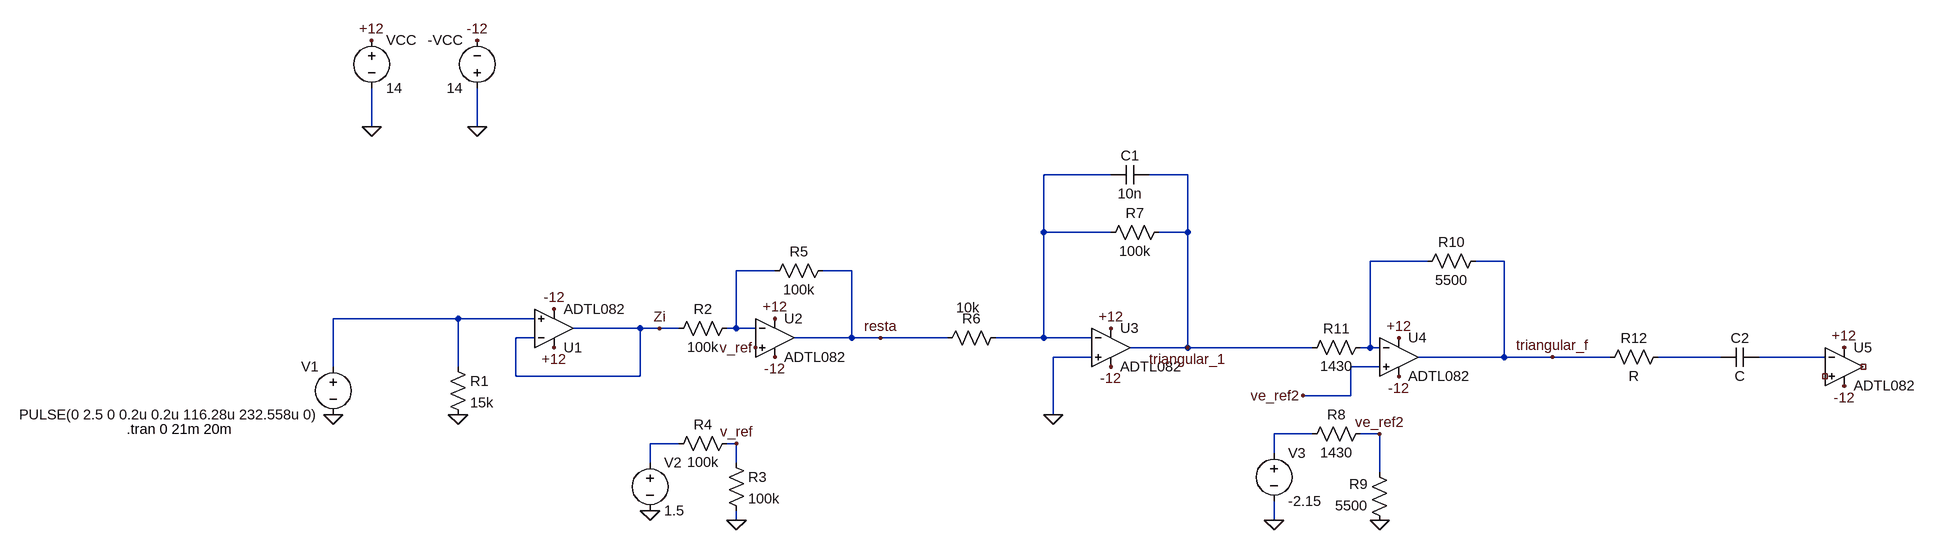
[diagram p0: schematic Draft1.asc]
Draft1.asc, the LTspice schematic file:
Version 4.1
SHEET 1 2540 680
WIRE -160 -240 -160 -304
WIRE 16 -240 16 -304
WIRE 1072 -160 960 -160
WIRE 1200 -160 1136 -160
WIRE 960 -64 960 -160
WIRE 1072 -64 960 -64
WIRE 1200 -64 1200 -160
WIRE 1200 -64 1152 -64
WIRE 1600 -16 1504 -16
WIRE 1728 -16 1680 -16
WIRE 512 0 448 0
WIRE 640 0 592 0
WIRE -16 80 -224 80
WIRE 112 80 -16 80
WIRE 288 96 176 96
WIRE 320 96 288 96
WIRE 352 96 320 96
WIRE 448 96 448 0
WIRE 448 96 432 96
WIRE 480 96 448 96
WIRE 112 112 80 112
WIRE 640 112 640 0
WIRE 640 112 544 112
WIRE 688 112 640 112
WIRE 800 112 688 112
WIRE 960 112 960 -64
WIRE 960 112 880 112
WIRE 1040 112 960 112
WIRE 1200 128 1200 -64
WIRE 1200 128 1104 128
WIRE 1408 128 1200 128
WIRE 1504 128 1504 -16
WIRE 1504 128 1488 128
WIRE 1520 128 1504 128
WIRE 1040 144 976 144
WIRE 1728 144 1728 -16
WIRE 1728 144 1584 144
WIRE 1808 144 1728 144
WIRE 1904 144 1808 144
WIRE 2160 144 1984 144
WIRE 2384 144 2224 144
WIRE -224 160 -224 80
WIRE -16 160 -16 80
WIRE 1520 160 1472 160
WIRE 80 176 80 112
WIRE 288 176 288 96
WIRE 288 176 80 176
WIRE 1472 208 1472 160
WIRE 1472 208 1392 208
WIRE 976 240 976 144
WIRE 1408 272 1344 272
WIRE 1520 272 1488 272
WIRE 352 288 304 288
WIRE 448 288 432 288
WIRE 1344 304 1344 272
WIRE 304 320 304 288
WIRE 448 320 448 288
WIRE 1520 336 1520 272
WIRE 448 416 448 400
WIRE 1344 416 1344 384
FLAG 16 -240 0
FLAG -160 -240 0
FLAG -160 -384 +12
FLAG 16 -384 -12
FLAG -16 240 0
FLAG -224 240 0
FLAG 144 128 +12
FLAG 144 64 -12
FLAG 320 96 Zi
FLAG 512 80 +12
FLAG 512 144 -12
FLAG 448 416 0
FLAG 304 400 0
FLAG 448 288 v_ref
FLAG 480 128 v_ref
FLAG 688 112 resta
FLAG 1072 96 +12
FLAG 1072 160 -12
FLAG 976 240 0
FLAG 1552 112 +12
FLAG 1552 176 -12
FLAG 1344 416 0
FLAG 1520 416 0
FLAG 1520 272 ve_ref2
FLAG 1392 208 ve_ref2
FLAG 1200 128 triangular_1
FLAG 1808 144 triangular_f
FLAG 2416 128 +12
FLAG 2416 192 -12
SYMBOL OpAmps\\ADTL082 144 160 M180
SYMATTR InstName U1
SYMBOL voltage -224 144 M0
WINDOW 123 0 0 Left 0
WINDOW 39 0 0 Left 0
SYMATTR InstName V1
SYMATTR Value PULSE(0 2.5 0 0.2u 0.2u 116.28u 232.558u 0)
SYMBOL res -32 144 R0
SYMATTR InstName R1
SYMATTR Value 15k
SYMBOL voltage -160 -400 R0
WINDOW 123 0 0 Left 0
WINDOW 39 0 0 Left 0
SYMATTR InstName VCC
SYMATTR Value 14
SYMBOL voltage 16 -288 R180
WINDOW 0 24 96 Left 2
WINDOW 3 24 16 Left 2
SYMATTR InstName -VCC
SYMATTR Value 14
SYMBOL voltage 304 304 R0
WINDOW 123 0 0 Left 0
WINDOW 39 0 0 Left 0
SYMATTR InstName V2
SYMATTR Value 1.5
SYMBOL res 448 80 R90
WINDOW 0 0 56 VBottom 2
WINDOW 3 32 56 VTop 2
SYMATTR InstName R2
SYMATTR Value 100k
SYMBOL OpAmps\\ADTL082 512 48 R0
SYMATTR InstName U2
SYMBOL res 432 304 R0
SYMATTR InstName R3
SYMATTR Value 100k
SYMBOL res 448 272 R90
WINDOW 0 0 56 VBottom 2
WINDOW 3 32 56 VTop 2
SYMATTR InstName R4
SYMATTR Value 100k
SYMBOL res 496 16 R270
WINDOW 0 32 56 VTop 2
WINDOW 3 0 56 VBottom 2
SYMATTR InstName R5
SYMATTR Value 100k
SYMBOL OpAmps\\ADTL082 1072 64 R0
SYMATTR InstName U3
SYMBOL res 896 96 R90
WINDOW 0 0 56 VBottom 2
WINDOW 3 -50 62 VTop 2
SYMATTR InstName R6
SYMATTR Value 10k
SYMBOL res 1168 -80 R90
WINDOW 0 0 56 VBottom 2
WINDOW 3 32 56 VTop 2
SYMATTR InstName R7
SYMATTR Value 100k
SYMBOL cap 1136 -176 R90
WINDOW 0 0 32 VBottom 2
WINDOW 3 32 32 VTop 2
SYMATTR InstName C1
SYMATTR Value 10n
SYMBOL OpAmps\\ADTL082 1552 80 R0
SYMATTR InstName U4
SYMBOL voltage 1344 288 R0
SYMATTR InstName V3
SYMATTR Value -2.15
SYMBOL res 1504 256 R90
WINDOW 0 0 56 VBottom 2
WINDOW 3 32 56 VTop 2
SYMATTR InstName R8
SYMATTR Value 1430
SYMBOL res 1536 432 R180
WINDOW 0 36 76 Left 2
WINDOW 3 36 40 Left 2
SYMATTR InstName R9
SYMATTR Value 5500
SYMBOL res 1584 0 R270
WINDOW 0 32 56 VTop 2
WINDOW 3 0 56 VBottom 2
SYMATTR InstName R10
SYMATTR Value 5500
SYMBOL res 1392 144 R270
WINDOW 0 32 56 VTop 2
WINDOW 3 0 56 VBottom 2
SYMATTR InstName R11
SYMATTR Value 1430
SYMBOL OpAmps\\ADTL082 2416 96 R0
SYMATTR InstName U5
SYMBOL res 2000 128 R90
WINDOW 0 0 56 VBottom 2
WINDOW 3 32 56 VTop 2
SYMATTR InstName R12
SYMBOL cap 2224 128 R90
WINDOW 0 0 32 VBottom 2
WINDOW 3 32 32 VTop 2
SYMATTR InstName C2
TEXT -568 264 Left 2 !.tran 0 21m 20m

The netlist it stands for:
* Draft1.asc
X§U1 N004 Zi +12 -12 Zi ADTL082  ; pins In+ In- V+ V- OUT
V1 N004 0 PULSE(0 2.5 0 0.2u 0.2u 116.28u 232.558u 0)
R1 N004 0 15k
VCC +12 0 14
V§-VCC 0 -12 14
V2 N008 0 1.5
R2 N003 Zi 100k
X§U2 v_ref N003 +12 -12 resta ADTL082  ; pins In+ In- V+ V- OUT
R3 v_ref 0 100k
R4 v_ref N008 100k
R5 N003 resta 100k
X§U3 0 N001 +12 -12 triangular_1 ADTL082  ; pins In+ In- V+ V- OUT
R6 N001 resta 10k
R7 triangular_1 N001 100k
C1 triangular_1 N001 10n
X§U4 ve_ref2 N002 +12 -12 triangular_f ADTL082  ; pins In+ In- V+ V- OUT
V3 N007 0 -2.15
R8 ve_ref2 N007 1430
R9 0 ve_ref2 5500
R10 N002 triangular_f 5500
R11 triangular_1 N002 1430
X§U5 NC_01 N006 +12 -12 NC_02 ADTL082  ; pins In+ In- V+ V- OUT
R12 N005 triangular_f R
C2 N006 N005 C
.tran 0 21m 20m
.lib ADI.lib
.backanno
.end